# Altium schematic sheet 02_STM32_DEBUG_IO.SchDoc
size A3; SheetNumber: 3; SheetTotal: 5
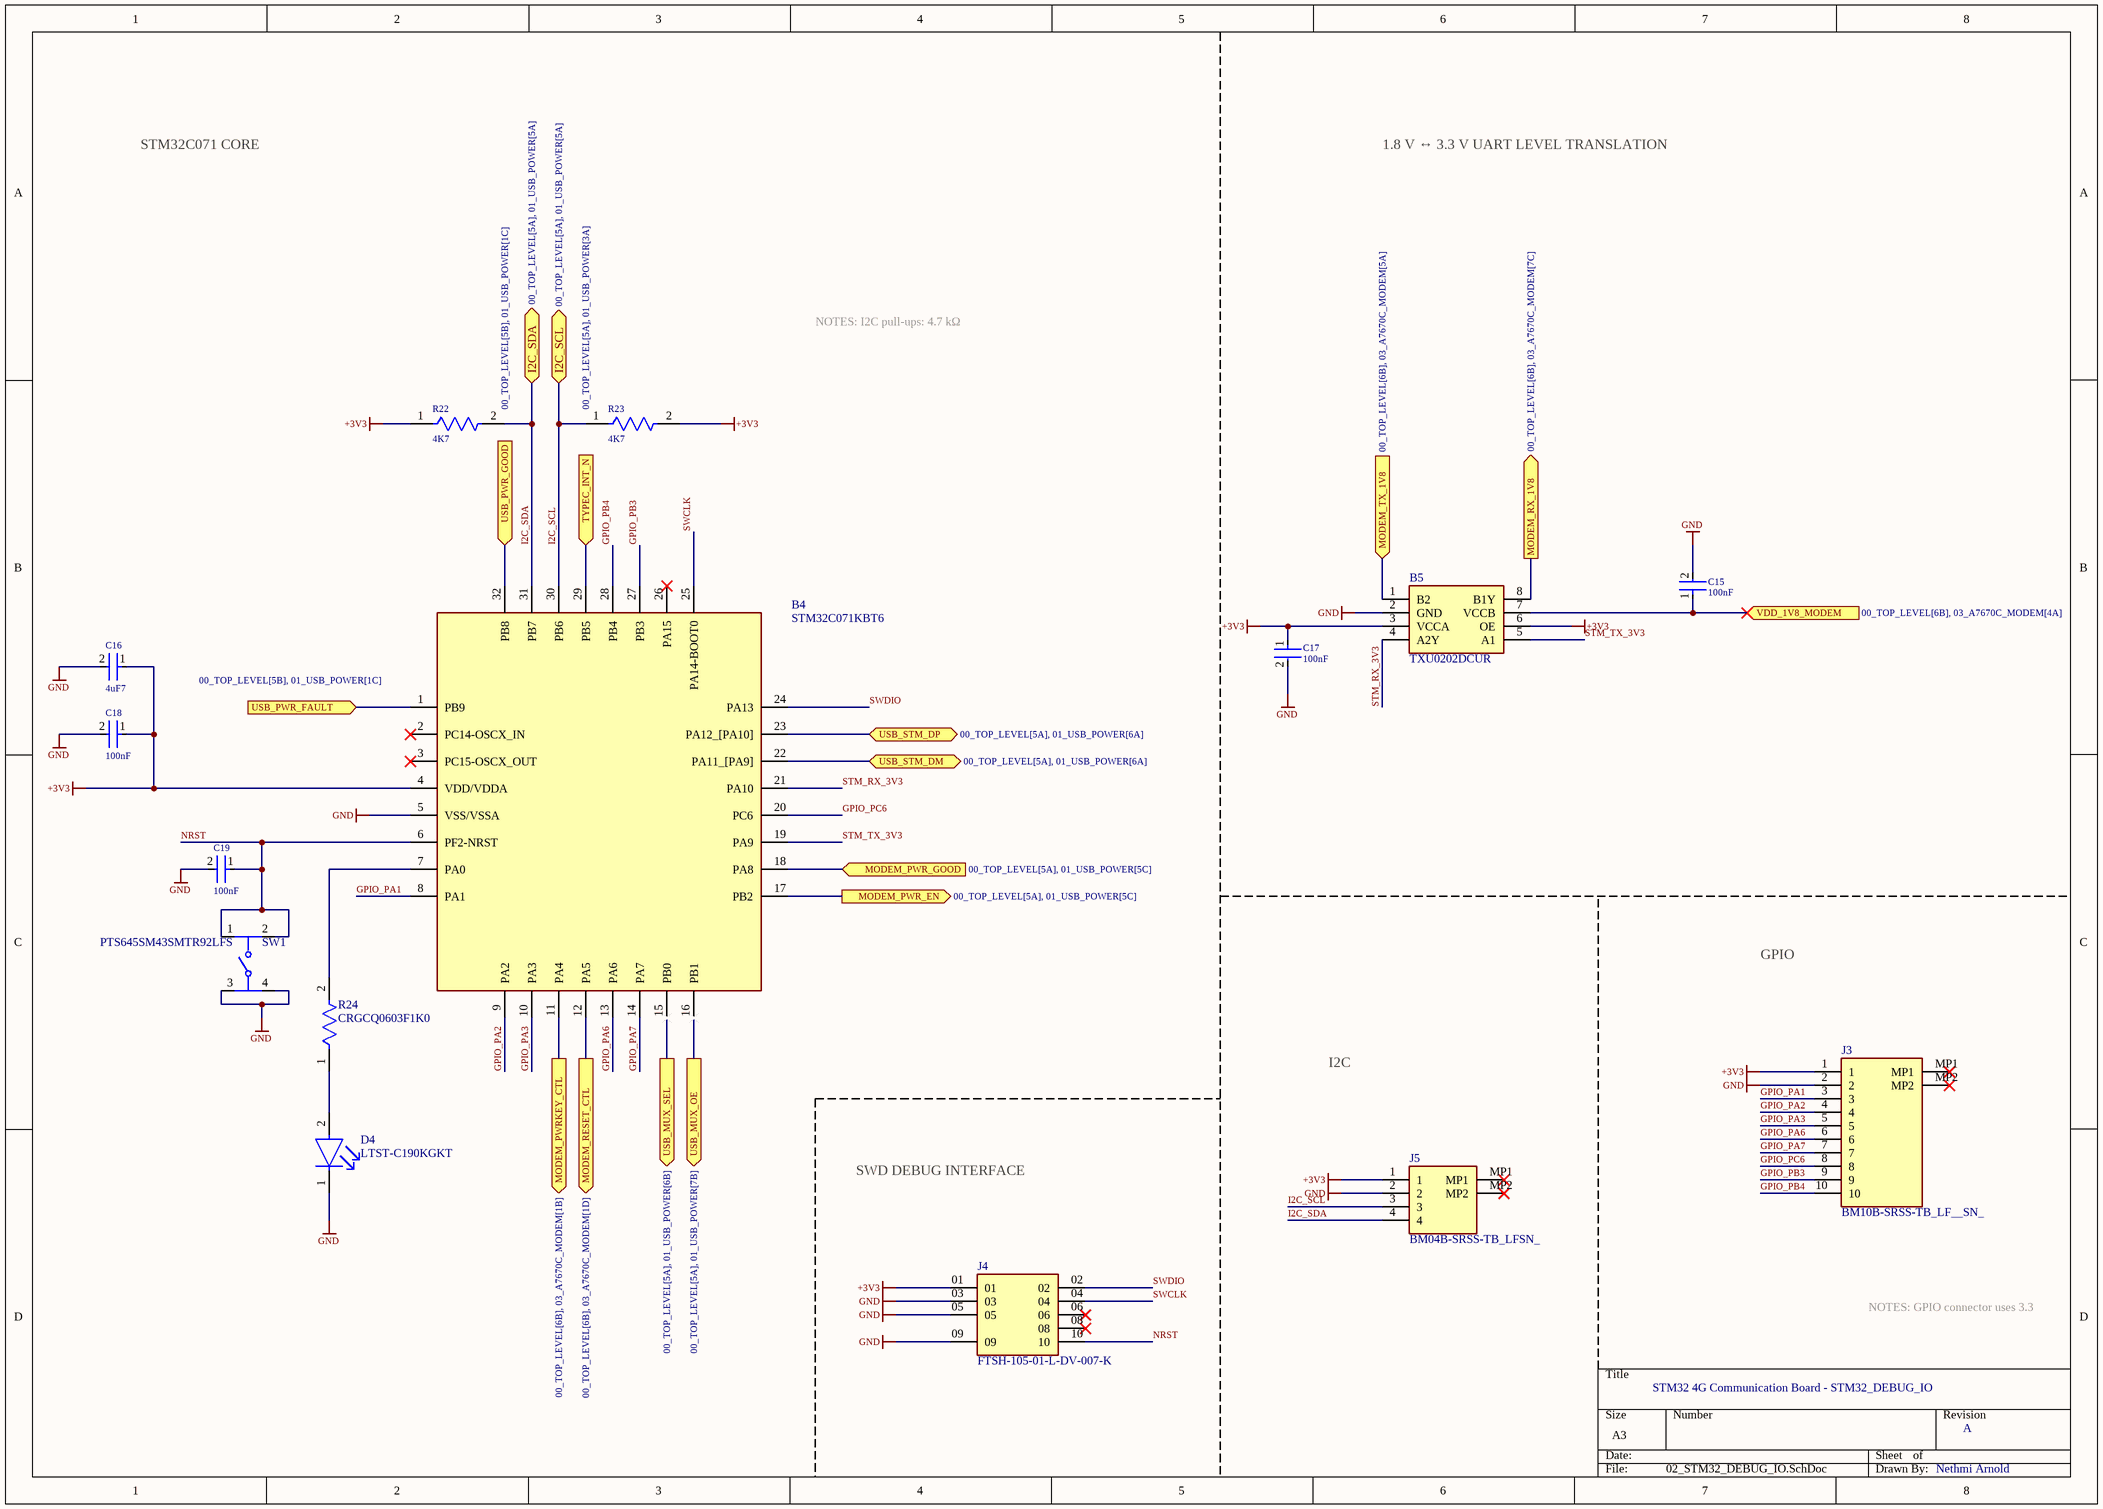
[diagram p0: 02_STM32_DEBUG_IO.SchDoc]

## Parts
B4  STM32C071KBT6  [QFP80P900X900X160-32N]
B5  TXU0202DCUR  [SOP50P310X90-8N]
C15  100nF  [FP-CC0402-IPC_C]
C16  4uF7  [FP-GRM21B-0_15-MFG]
C17  100nF  [FP-CC0402-IPC_C]
C18  100nF  [FP-CC0402-IPC_C]
C19  100nF  [FP-CC0402-IPC_C]
D4  LTST-C190KGKT  [FP-LTST-C190KGKT-MFG]
J3  BM10B-SRSS-TB_LF__SN_  [BM10BSRSSTBLFSN]
J4  FTSH-105-01-L-DV-007-K  [SAMTEC_FTSH-105-01-L-DV-007-K]
J5  BM04B-SRSS-TB_LFSN_  [BM04BSRSSTBLFSN]
R22  4K7  [FP-AC0603-IPC_C]
R23  4K7  [FP-AC0603-IPC_C]
R24  CRGCQ0603F1K0  [FP-CRGCQ0603-IPC_C]
SW1  PTS645SM43SMTR92LFS  [PTS645SM43SMTR92LFS_MFG]

## Ports
I2C_SCL (bidir, see 00_TOP_LEVEL[5A], 01_USB_POWER[5A]), I2C_SDA (bidir, see 00_TOP_LEVEL[5A], 01_USB_POWER[5A]), MODEM_PWR_EN (out, see 00_TOP_LEVEL[5A], 01_USB_POWER[5C]), MODEM_PWR_GOOD (in, see 00_TOP_LEVEL[5A], 01_USB_POWER[5C]), MODEM_PWRKEY_CTL (out, see 00_TOP_LEVEL[6B], 03_A7670C_MODEM[1B]), MODEM_RESET_CTL (out, see 00_TOP_LEVEL[6B], 03_A7670C_MODEM[1D]), MODEM_RX_1V8 (out, see 00_TOP_LEVEL[6B], 03_A7670C_MODEM[7C]), MODEM_TX_1V8 (in, see 00_TOP_LEVEL[6B], 03_A7670C_MODEM[5A]), TYPEC_INT_N (in, see 00_TOP_LEVEL[5A], 01_USB_POWER[3A]), USB_MUX_OE (out, see 00_TOP_LEVEL[5A], 01_USB_POWER[7B]), USB_MUX_SEL (out, see 00_TOP_LEVEL[5A], 01_USB_POWER[6B]), USB_PWR_FAULT (in, see 00_TOP_LEVEL[5B], 01_USB_POWER[1C]), USB_PWR_GOOD (in, see 00_TOP_LEVEL[5B], 01_USB_POWER[1C]), USB_STM_DM (bidir, see 00_TOP_LEVEL[5A], 01_USB_POWER[6A]), USB_STM_DP (bidir, see 00_TOP_LEVEL[5A], 01_USB_POWER[6A]), VDD_1V8_MODEM (in, see 00_TOP_LEVEL[6B], 03_A7670C_MODEM[4A])

## Nets
+3V3: B4.4(VDD/VDDA) B5.3(VCCA) B5.6(OE) C16.1 C17.1 C18.1 J3.1 J4.01 J5.1 R22.1 R23.2
GND: B4.5(VSS/VSSA) B5.2(GND) C15.2 C16.2 C17.2 C18.2 C19.2 D4.1(C) J3.2 J4.03 J4.05 J4.09 J5.2 SW1.3 SW1.4
GPIO_PA1: B4.8(PA1) J3.3
GPIO_PA2: B4.9(PA2) J3.4
GPIO_PA3: B4.10(PA3) J3.5
GPIO_PA6: B4.13(PA6) J3.6
GPIO_PA7: B4.14(PA7) J3.7
GPIO_PB3: B4.27(PB3) J3.9
GPIO_PB4: B4.28(PB4) J3.10
GPIO_PC6: B4.20(PC6) J3.8
I2C_SCL: B4.30(PB6) J5.3 R23.1 ; port I2C_SCL
I2C_SDA: B4.31(PB7) J5.4 R22.2 ; port I2C_SDA
MODEM_PWR_EN: B4.17(PB2) ; port MODEM_PWR_EN
MODEM_PWR_GOOD: B4.18(PA8) ; port MODEM_PWR_GOOD
MODEM_PWRKEY_CTL: B4.11(PA4) ; port MODEM_PWRKEY_CTL
MODEM_RESET_CTL: B4.12(PA5) ; port MODEM_RESET_CTL
MODEM_RX_1V8: B5.8(B1Y) ; port MODEM_RX_1V8
MODEM_TX_1V8: B5.1(B2) ; port MODEM_TX_1V8
NRST: B4.6(PF2-NRST) C19.1 J4.10 SW1.1 SW1.2
STM_RX_3V3: B4.21(PA10) B5.4(A2Y)
STM_TX_3V3: B4.19(PA9) B5.5(A1)
SWCLK: B4.25(PA14-BOOT0) J4.04
SWDIO: B4.24(PA13) J4.02
TYPEC_INT_N: B4.29(PB5) ; port TYPEC_INT_N
USB_MUX_OE: B4.16(PB1) ; port USB_MUX_OE
USB_MUX_SEL: B4.15(PB0) ; port USB_MUX_SEL
USB_PWR_FAULT: B4.1(PB9) ; port USB_PWR_FAULT
USB_PWR_GOOD: B4.32(PB8) ; port USB_PWR_GOOD
USB_STM_DM: B4.22(PA11_[PA9]) ; port USB_STM_DM
USB_STM_DP: B4.23(PA12_[PA10]) ; port USB_STM_DP
VDD_1V8_MODEM: B5.7(VCCB) C15.1 ; port VDD_1V8_MODEM
NetB4_7: B4.7(PA0) R24.2
NetD4_2: D4.2(A) R24.1

Not connected (* = marked no-connect by the designer): B4 2(PC14-OSCX_IN)* 3(PC15-OSCX_OUT)* 26(PA15)*; J3 MP1* MP2*; J4 06* 08*; J5 MP1* MP2*

## Notes on the sheet
- STM32C071 CORE
- 1.8 V ↔ 3.3 V UART LEVEL TRANSLATION
- NOTES: I2C pull-ups: 4.7 kΩ to +3V3
- GPIO
- I2C
- SWD DEBUG INTERFACE
- NOTES: GPIO connector uses 3.3 V logic.
- STM32 4G Communication Board - STM32_DEBUG_IO
- A
- Nethmi Arnold

## Library data of the parts
B4 = STM32C071KBT6: Mainstream Arm Cortex-M0+ MCU with 128 Kbytes of Flash memory, 24 Kbytes RAM, 48 MHz CPU, 2x USART, timers, ADC, comm. I/F, USB FS, 2-3.6V; Manufacturer_Name: STMicroelectronics; Geometry.Height: 1.6mm; Manufacturer_Part_Number: STM32C071KBT6; Mouser Part Number: *; Mouser Price/Stock: *; Arrow Part Number: STM32C071KBT6; Arrow Price/Stock: https://www.arrow.com/en/products/stm32c071kbt6/stmicroelectronics?utm_currency=USD&region=nac; Datasheet Link: https://www.st.com/resource/en/datasheet/stm32c071c8.pdf
B5 = TXU0202DCUR: Translation - Voltage Levels Two channel fixed-direction level shifter with channels in opposite direction; Manufacturer_Name: Texas Instruments; Geometry.Height: 0.9mm; Manufacturer_Part_Number: TXU0202DCUR; Mouser Part Number: 595-TXU0202DCUR; Mouser Price/Stock: https://www.mouser.co.uk/ProductDetail/Texas-Instruments/TXU0202DCUR?qs=t7xnP681wgVssPLUozppFA%3D%3D; Arrow Part Number: TXU0202DCUR; Arrow Price/Stock: https://www.arrow.com/en/products/txu0202dcur/texas-instruments.html?utm_currency=USD&region=nac; Datasheet Link: https://www.ti.com/product/ja-jp/TXU0202
C15 C17-C19 = CMP-03422-000905-1: CC0402 100 nF X5R 20.00% 25 V; Manufacturer: YAGEO; Manufacturer Part Number: CC0402MRX5R8BB104; Temperature Coefficient: 30ppm/°C; Voltage Rating: 25 V; Tolerance: 0.2; Material: Ceramic; Automotive Grade: NA; Ipc Land Pattern Name: CAPC10050X50; RoHS: TRUE; Value: 100 nF; Footprint Url: http://www.yageo.com/exep/pages/download/literatures/UPY-C_GEN_24.pdf; ComponentLink2URL: http://www.yageo.com/documents/recent/UPY-GP_NP0_16V-to-50V_16.pdf; Device Class L2: Capacitors; Octopart: https://octopart.com/cc0402mrx5r8bb104-yageo-95634517; Device Class L3: Ceramic Capacitors; Capacitance: 100 nF; Temperature: -55°C to +125°C; Package: CC0402; Automotive: No; Temperature Range Low: -55°C; Temperature Range High: +125°C; Lead Free: Yes; Temperature Characteristic: X5R; Category: Cap; Height: 0.55mm; Device Class L1: Passive Components; ComponentLink2Description: Datasheet
C16 = CMP-06035-056279-1: Chip Multilayer Ceramic Capacitors for General Purpose, 0805, 4.7uF, X7R, 15%, 10%, 10V; Dielectric: X7R; Case/Package: 0805; Voltage Rating (DC): 10V; Thickness: 1.25mm; Capacitance: 4.7uF; Tolerance: 10%; Length: 2mm; Width: 1.25mm
D4 = CMP-2000-05197-2: LED GREEN CLEAR CHIP SMD; Test Current: 20mA; Power Rating: 75mW; Forward Voltage: 2V; Wavelength: 574nm; Number of LEDs: 1; Reverse Voltage: 5V; Dominant Wavelength: 571nm; Lens Style: Diffused; Luminous Intensity: 35mcd; Forward Current: 30mA; Viewing Angle: 130°; Lens Color: Colorless; Width: 0.8mm; Case Code (Imperial): 0603; Case Code (Metric): 1608; Number of Pins: 2; Radiation Hardening: No; Package Quantity: 1; Lead Free: Lead Free; Lens Transparency: Clear; Depth: 0.8mm; Power Dissipation: 75mW; Mount: Surface Mount; Max Operating Temperature: 85°C; Case/Package: 0603; Height: 0.8mm; Illumination Color: Green; Color: Green; Length: 1.6mm; Packaging: Tape and Reel; Number of Elements: 1; Min Operating Temperature: -55°C
J3 = BM10B-SRSS-TB_LF__SN_: Pin Header, Top Entry, Wire-to-Board, 1 mm, 1 Rows, 10 Contacts, Surface Mount, SR; Manufacturer_Name: JST (JAPAN SOLDERLESS TERMINALS); Manufacturer_Part_Number: BM10B-SRSS-TB(LF)(SN); Geometry.Height: 6.3mm; Mouser Part Number: N/A; Mouser Price/Stock: https://www.mouser.co.uk/ProductDetail/JST-Commercial/BM10B-SRSS-TBLFSN?qs=QpmGXVUTftHkAAIgDl8JVg%3D%3D; Arrow Part Number: BM10B-SRSS-TB(LF)(SN); Arrow Price/Stock: https://www.arrow.com/en/products/bm10b-srss-tb-lf-sn/jst-manufacturing?utm_currency=USD&region=europe; Datasheet Link: https://www.jst-mfg.com/product/pdf/eng/eSH.pdf
J4 = FTSH-105-01-L-DV-007-K: Connector Header Surface Mount 10 position 0.050 (1.27mm); MF: Samtec; SnapEDA_Link: https://www.snapeda.com/parts/FTSH-105-01-L-DV-007-K/Samtec+Inc./view-part/?ref=snap; Package: None; Value: *; MP: FTSH-105-01-L-DV-007-K; Check_prices: https://www.snapeda.com/parts/FTSH-105-01-L-DV-007-K/Samtec+Inc./view-part/?ref=eda
J5 = BM04B-SRSS-TB_LFSN_: JST SH, 4 Way, 1 Row, Straight PCB Header; Manufacturer_Name: JST (JAPAN SOLDERLESS TERMINALS); Manufacturer_Part_Number: BM04B-SRSS-TB(LFSN); Geometry.Height: 4.25mm; Mouser Part Number: *; Mouser Price/Stock: *; Arrow Part Number: BM04B-SRSS-TB(LFSN); Arrow Price/Stock: https://www.arrow.com/en/products/bm04b-srss-tb-lf-sn/jst-manufacturing.html?utm_currency=USD&region=asia; Datasheet Link: http://uk.rs-online.com/web/p/products/5151541P
R22 R23 = CMP-03412-006483-2: RES 4.7KΩ 1.00% 0.1W 0603; Tolerance: 1%; Resistance: 4.7kR; Case/Package: 0603; RoHS Compliant: Yes
R24 = CMP-03211-008566-1: CRGCQ0603 1KΩ 1% ±100ppm/°C 75V; Manufacturer: TE Connectivity; Tolerance: 0.01; Power Rating: 0.1W; Device Class L3: Chip SMD Resistors; Height: 0.55mm; Lead Free: Yes; Value: 1KΩ; ComponentLink2Description: Datasheet; Category: Res; RoHS: TRUE; Series: CRGCQ; Ipc Land Pattern Name: RESC16080X45; Temperature: -55°C to +155°C; Device Class L2: Resistors; Package: CRGCQ0603; Ambient Temperature Range High: +70°C; Octopart: https://octopart.com/crgcq0603f1k0-te+connectivity-91018050; Manufacturer Part Number: CRGCQ0603F1K0; Temperature Range High: +155°C; ComponentLink2URL: https://www.te.com/commerce/DocumentDelivery/DDEController?Action=showdoc&DocId=Data+Sheet%7F1773204-3%7F1%7Fpdf%7FEnglish%7FENG_DS_1773204-3_1.pdf%7F4-2176339-694; Temperature Coefficient: ±100ppm/°C; Voltage Rating: 75V; Composition: Thick Film; Resistance: 1KΩ; Temperature Range Low: -55°C; Device Class L1: Passive Components
SW1 = CMP-2000-05160-3: Switch Tactile N.O SPST Round Button Gull Wing 0.05A 12VDC 100000Cycle 1.57N SMD T/R; Manufacturer: C&K; Contact Resistance: 100mΩ; Throw Configuration: SPST-NO; Symbol Hash: e4f2503661fe04264f50fb928c13ad2fe87bcd91adbcb66dbad76167d37ba389; Verification Version: 0.0.0.3; Contact Current Rating: 50mA; Operating Force: 160gf; Voltage Rating Dc: 12V; Electromechanical Life: 100000Cycles; Switch Function: Off-Mom; Life (Cycles): 100kcycles; Actuator Material: Nylon, Polyamide; Number of Positions: 1; Actuator Length: 850µm; Illumination Type: Illuminated, Non-Illuminated; Insulation Resistance: 100GΩ; Mouser Part Number: 611-PTS645SM43SMTR92; Mouser Description: SWITCH TACTILE SPST-NO 0.05A 12V; Temperature Range High: +85°C; Part Number: PTS645SM43SMTR92LFS; Digikey Description: SWITCH TACTILE SPST-NO 0.05A 12V; Digikey Part Number: CKN9112CT-ND; ComponentLink2URL: https://www.ckswitches.com/media/1471/pts645.pdf; ComponentLink2Description: Datasheet; Lead Free: Yes; Height: 4.4mm; Automotive: No; Temperature Range Low: -20°C; RoHS: TRUE; Mount: Surface Mount; Package: 0; ComponentLink1Description: Upverter; Supplier 2: Mouser; Supplier 1: Digi-Key; ComponentLink1URL: https://upverter.com/part/id/2502ca7897830fb2/; Supplier Part Number 2: 611-PTS645SM43SMTR92; Supplier Part Number 1: CKN9112CT-ND; helpURL: https://upverter.com/part/id/2502ca7897830fb2/; Temperature: -20°C to +85°C; RoHS: Compliant; Electrical Life: 100kcycles; Lead Free: Lead Free; Contact Plating: Silver; Case/Package: SMD/SMT; Voltage Rating (DC): 12V; Termination: Solder; Max Current Rating: 50mA; Height: 3.45mm; Manufacturer Package Identifier: PTS645SM43SMTR92LFS; ComponentLink1URL: http://www.ck-components.com/; Max Voltage Rating (DC): 12V; Lifecycle Status: Production; Min Operating Temperature: -20°C; Throw Configuration: SPST; China RoHS: Compliant; ComponentLink1Description: Manufacturer's Website; Operating Force: 1.57N; Depth: 9mm; Contact Material: Silver; Length: 6mm; Current Rating: 50mA; Color: Black; Mechanical Life: 100kcycles; Orientation: Straight; Packaging: Cut Tape (CT); REACH SVHC: Yes; Max Operating Temperature: 60°C; ComponentLink2Description: Datasheet URL; HelpURL: https://www.ckswitches.com/media/1471/pts645.pdf